# Altium schematic sheet diff_probe.SchDoc
size A4; CompanyName: MCI Management Center Innsbruck; Address1: Universitätsstraße 15; Address2: A-6020 Innsbruck
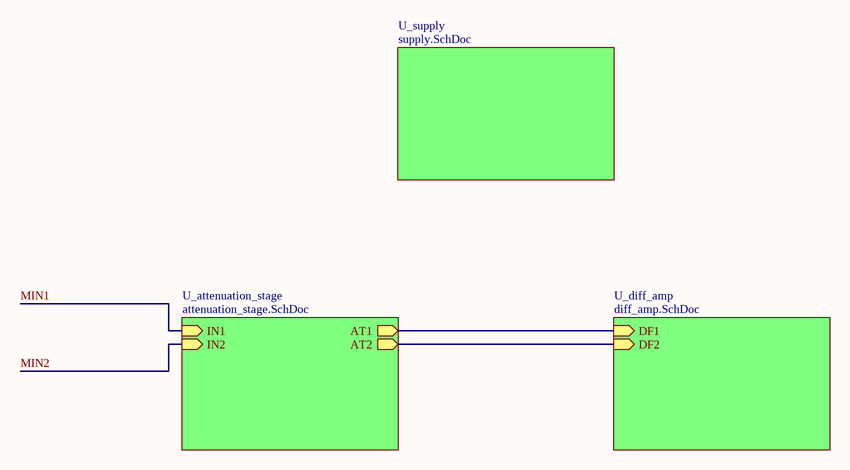
[diagram p0: diff_probe.SchDoc]

## Sub-sheets
U_attenuation_stage = attenuation_stage.SchDoc: AT1 (out), AT2 (out), IN1 (in), IN2 (in)
U_diff_amp = diff_amp.SchDoc: DF1 (in), DF2 (in)
U_supply = supply.SchDoc: no entries

## Nets
MIN1: sheet U_attenuation_stage/IN1
MIN2: sheet U_attenuation_stage/IN2
(unnamed): sheet U_diff_amp/DF1, sheet U_attenuation_stage/AT1
(unnamed): sheet U_diff_amp/DF2, sheet U_attenuation_stage/AT2

## Notes on the sheet
- Size:
- Mechatronics - Electrical Engineering
- Project:
- A4
- Title:
- Date:
- Revision:
- Sheet:
- of
- File:
- Author: